# Altium schematic sheet DevKitESP32.SchDoc
size A; SheetNumber: 1; SheetTotal: 6
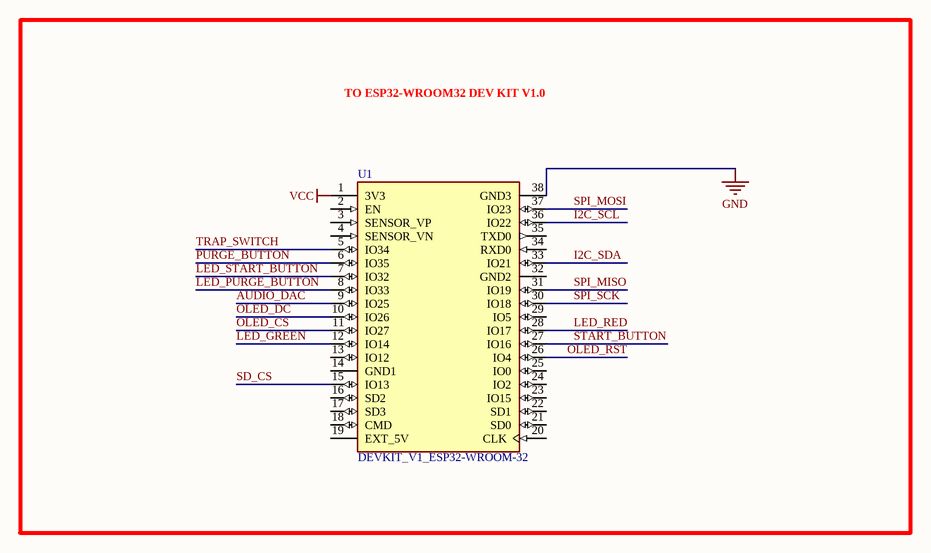
[diagram p0: DevKitESP32.SchDoc]

## Parts
U1  DEVKIT_V1_ESP32-WROOM-32  [MODULE_DEVKIT_V1_ESP32-WROOM-32]

## Blocks framed on the sheet
TO ESP32-WROOM32 DEV KIT V1.0: U1

## Nets
GND: U1.38(GND3)
VCC: U1.1(3V3)
AUDIO_DAC: U1.9(IO25)
I2C_SCL: U1.36(IO22)
I2C_SDA: U1.33(IO21)
LED_GREEN: U1.12(IO14)
LED_PURGE_BUTTON: U1.8(IO33)
LED_RED: U1.28(IO17)
LED_START_BUTTON: U1.7(IO32)
OLED_CS: U1.11(IO27)
OLED_DC: U1.10(IO26)
OLED_RST: U1.26(IO4)
PURGE_BUTTON: U1.6(IO35)
SD_CS: U1.15(IO13)
SPI_MISO: U1.31(IO19)
SPI_MOSI: U1.37(IO23)
SPI_SCK: U1.30(IO18)
START_BUTTON: U1.27(IO16)
TRAP_SWITCH: U1.5(IO34)

Not connected (* = marked no-connect by the designer): U1 2(EN) 3(SENSOR_VP) 4(SENSOR_VN) 13(IO12) 14(GND1) 16(SD2) 17(SD3) 18(CMD) 19(EXT_5V) 20(CLK) 21(SD0) 22(SD1) 23(IO15) 24(IO2) 25(IO0) 29(IO5) 32(GND2) 34(RXD0) 35(TXD0)

## Library data of the parts
U1 = DEVKIT_V1_ESP32-WROOM-32: WROOM-32 Development Board ESP32 ESP-32S WiFi Bluetooth Dev Module; MF: Espressif Systems; MP: DEVKIT V1 ESP32-WROOM-32; SnapEDA_Link: https://www.snapeda.com/parts/DEVKIT%20V1%20ESP32-WROOM-32/Espressif+Systems/view-part/?ref=snap; Package: Package; Value: *; Check_prices: https://www.snapeda.com/parts/DEVKIT%20V1%20ESP32-WROOM-32/Espressif+Systems/view-part/?ref=eda